# Altium schematic sheet Stepper_Driver.SchDoc
size 431 x 279 mm; SheetNumber: 3; SheetTotal: 6
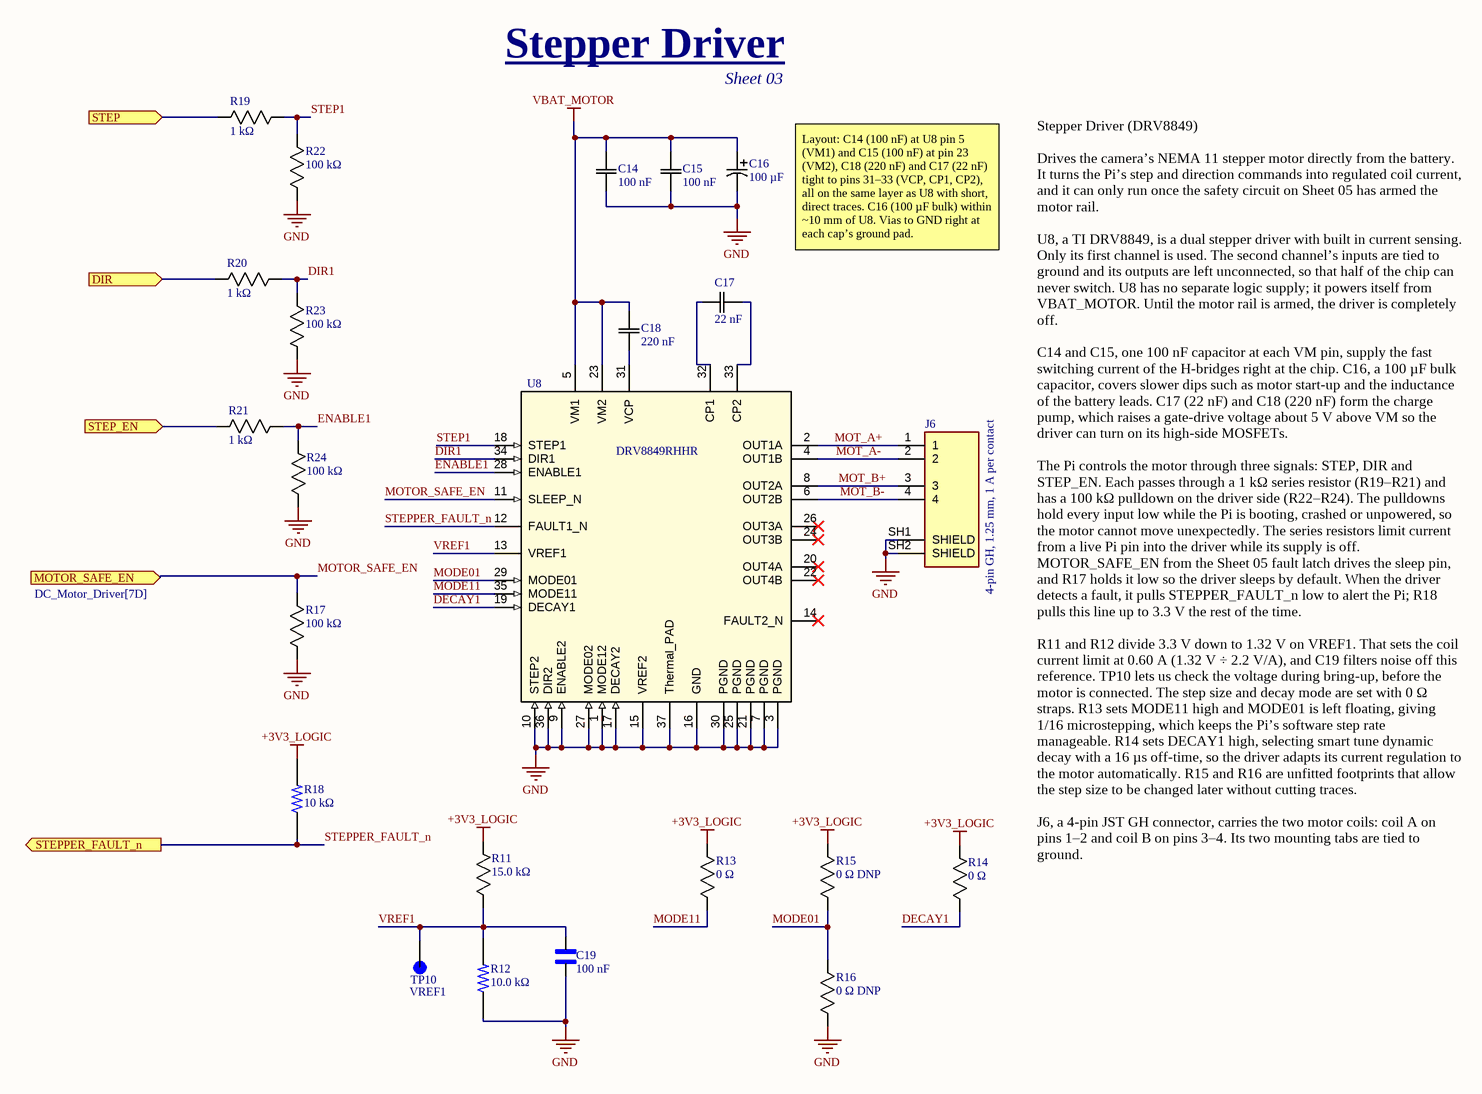
[diagram p0: Stepper_Driver.SchDoc]

## Parts
C14  100 nF  [G-155_MUR]
C15  100 nF  [G-155_MUR]
C16  100 µF  [CAP_8 X 6.2_PAN]
C17  22 nF  [G-188_MUR]
C18  220 nF  [G-188_MUR]
C19  100 nF  [CAPC1608X90N]
J6  4-pin GH, 1.25 mm, 1 A per contact  [JST_SM04B-GHS-TB(LF)(SN)-]
R11  15.0 kΩ  [RC0603N_YAG]
R12  10.0 kΩ  [RESC1607X60N]
R13  0 Ω  [RC0603N_YAG]
R14  0 Ω  [RC0603N_YAG]
R15  0 Ω DNP  [RC0603N_YAG]
R16  0 Ω DNP  [RC0603N_YAG]
R17  100 kΩ  [RC0603N_YAG]
R18  10 kΩ  [RESC1607X60N]
R19  1 kΩ  [RC0603N_YAG]
R20  1 kΩ  [RC0603N_YAG]
R21  1 kΩ  [RC0603N_YAG]
R22  100 kΩ  [RC0603N_YAG]
R23  100 kΩ  [RC0603N_YAG]
R24  100 kΩ  [RC0603N_YAG]
TP10  VREF1  [KEYSTONE_5015]
U8  DRV8849RHHR  [RHH0036H-IPC_A]

## Ports
DIR (in), MOTOR_SAFE_EN (in, see DC_Motor_Driver[7D]), STEP (in), STEP_EN (in), STEPPER_FAULT_n (out)

## Nets
+3V3_LOGIC: R11.1 R13.2 R14.2 R15.1 R18.2
GND: C14.2 C15.2 C16.2 C19.1 J6.SH1(SHIELD) J6.SH2(SHIELD) R12.1 R16.2 R17.1 R22.1 R23.1 R24.1 U8.1(MODE12) U8.3(PGND) U8.7(PGND) U8.9(ENABLE2) U8.10(STEP2) U8.15(VREF2) U8.16(GND) U8.17(DECAY2) U8.21(PGND) U8.25(PGND) U8.27(MODE02) U8.30(PGND) U8.36(DIR2) U8.37(Thermal_PAD)
VBAT_MOTOR: C14.1 C15.1 C16.1 C18.2 U8.5(VM1) U8.23(VM2)
DECAY1: R14.1 U8.19(DECAY1)
DIR: R20.1 ; port DIR
DIR1: R20.2 R23.2 U8.34(DIR1)
ENABLE1: R21.2 R24.2 U8.28(ENABLE1)
MODE01: R15.2 R16.1 U8.29(MODE01)
MODE11: R13.1 U8.35(MODE11)
MOT_A+: J6.1 U8.2(OUT1A)
MOT_A-: J6.2 U8.4(OUT1B)
MOT_B+: J6.3 U8.8(OUT2A)
MOT_B-: J6.4 U8.6(OUT2B)
MOTOR_SAFE_EN: R17.2 U8.11(SLEEP_N) ; port MOTOR_SAFE_EN
STEP: R19.1 ; port STEP
STEP1: R19.2 R22.2 U8.18(STEP1)
STEP_EN: R21.1 ; port STEP_EN
STEPPER_FAULT_n: R18.1 U8.12(FAULT1_N) ; port STEPPER_FAULT_n
VREF1: C19.2 R11.2 R12.2 TP10.TP U8.13(VREF1)
NetC17_1: C17.1 U8.32(CP1)
NetC17_2: C17.2 U8.33(CP2)
NetC18_1: C18.1 U8.31(VCP)

Not connected (* = marked no-connect by the designer): U8 14(FAULT2_N)* 20(OUT4A)* 22(OUT4B)* 24(OUT3B)* 26(OUT3A)*

## Notes on the sheet
- Stepper Driver
- Sheet 03
- Layout: C14 (100 nF) at U8 pin 5 (VM1) and C15 (100 nF) at pin 23 (VM2), C18 (220 nF) and C17 (22 nF) tight to pins 31–33 (VCP, CP1, CP2), all on the same layer as U8 with short, direct traces. C16 (100 µF bulk) within ~10 mm of U8. Vias to GND right at each cap’s ground pad.
- Stepper Driver (DRV8849)
  Drives the camera’s NEMA 11 stepper motor directly from the battery. It turns the Pi’s step and direction commands into regulated coil current, and it can only run once the safety circuit on Sheet 05 has armed the motor rail.
  U8, a TI DRV8849, is a dual stepper driver with built in current sensing. Only its first channel is used. The second channel’s inputs are tied to ground and its outputs are left unconnected, so that half of the chip can never switch. U8 has no separate logic supply; it powers itself from VBAT_MOTOR. Until the motor rail is armed, the driver is completely off.
  C14 and C15, one 100 nF capacitor at each VM pin, supply the fast switching current of the H-bridges right at the chip. C16, a 100 µF bulk capacitor, covers slower dips such as motor start-up and the inductance of the battery leads. C17 (22 nF) and C18 (220 nF) form the charge pump, which raises a gate-drive voltage about 5 V above VM so the driver can turn on its high-side MOSFETs.
  The Pi controls the motor through three signals: STEP, DIR and STEP_EN. Each passes through a 1 kΩ series resistor (R19–R21) and has a 100 kΩ pulldown on the driver side (R22–R24). The pulldowns hold every input low while the Pi is booting, crashed or unpowered, so the motor cannot move unexpectedly. The series resistors limit current from a live Pi pin into the driver while its supply is off. MOTOR_SAFE_EN from the Sheet 05 fault latch drives the sleep pin, and R17 holds it low so the driver sleeps by default. When the driver detects a fault, it pulls STEPPER_FAULT_n low to alert the Pi; R18 pulls this line up to 3.3 V the rest of the time.
  R11 and R12 divide 3.3 V down to 1.32 V on VREF1. That sets the coil current limit at 0.60 A (1.32 V ÷ 2.2 V/A), and C19 filters noise off this reference. TP10 lets us check the voltage during bring-up, before the motor is connected. The step size and decay mode are set with 0 Ω straps. R13 sets MODE11 high and MODE01 is left floating, giving 1/16 microstepping, which keeps the Pi’s software step rate manageable. R14 sets DECAY1 high, selecting smart tune dynamic decay with a 16 µs off-time, so the driver adapts its current regulation to the motor automatically. R15 and R16 are unfitted footprints that allow the step size to be changed later without cutting traces.
  J6, a 4-pin JST GH connector, carries the two motor coils: coil A on pins 1–2 and coil B on pins 3–4. Its two mounting tabs are tied to ground.
- DWG. NO.
- REV.
- SHT.
- THIS DOCUMENT AND THE DATA DISCLOSED HEREIN OR HEREWITH IS THE PROPERTY OF ALTIUM LIMITED AND MAY BE FREELY DISTRIBUTED IN WHOLE. NO RIGHTS ARE RESERVED OR EXPRESS OR IMPLIED WARANTEE GIVEN.
- REVISION
- DESCRIPTION
- DATE
- APPROVED
- ENG:
- APPROVALS
- PROJECT
- DSN:
- CHK:
- REFERENCE DOCUMENTS
- PROJECT REVISION:
- TITLE
- DOCUMENT REVISION:
- DESIGN ITEM:
- BOM:
- FAB DWG:
- PCB DWG:
- ASSY DWG:
- SCALE:
- SIZE
- B
- CAGE CODE
- FILE NAME
- DWG NO.
- SHEET
- OF
- REV

## Library data of the parts
C14 C15 = GRM1555C1H102JA01J: Murata GRM188R71H104KA93D / GRM1555C1H102JA01J / https://www.digikey.com/en/products/detail/murata-electronics/GRM1555C1H102JA01J/2543864?gclsrc=aw.ds&gad_source=1&gad_campaignid=120565755&gbraid=0AAAAADrbLlhBK6RSg5Z4LknwR3Ym5VOXW&gclid=CjwKCAjwxpvXBhASEiwAue4B4XeGUFuPXtPsfbeMkMZ75lyWP21xskG24YTykYGaX4kwoUWy9fCN8hoClL4QAvD_BwE; Copyright: Copyright (C) 2025 Ultra Librarian. All rights reserved.; Manufacturer_Name: Murata; Manufacturer_Part_Number: GRM1555C1H102JA01J
C16 = EEE-FK1E101P: EEE-FK1E101P / Panasonic EEE-FK1E101P / 100 µF 25 V aluminum / https://www.digikey.com/en/products/detail/panasonic-industry/EEE-FK1E101P/765965; Copyright: Copyright (C) 2025 Ultra Librarian. All rights reserved.; Manufacturer_Name: Panasonic; Manufacturer_Part_Number: EEE-FK1E101P
C17 = GRM188R71H223KA01D: GRM188R71H223KA01D / Murata GRM188R71H223KA01D / 22 nF 50 V X7R / https://www.digikey.com/en/products/detail/murata-electronics/GRM188R71H223KA01D/587147?s=N4IgTCBcDaIOICUCyBGAHGhB2FAJMYAzANICCADCgCIgC6AvkA; Copyright: Copyright (C) 2026 Ultra Librarian. All rights reserved.; Manufacturer_Name: Murata; Manufacturer_Part_Number: GRM188R71H223KA01D
C18 = GRM188R71C224KA01D: GRM188R71C224KA01D / 220 nF / Murata GRM188R71C224KA01D 0603 / https://www.digikey.com/en/products/detail/murata-electronics/GRM188R71C224KA01D/702557?s=N4IgTCBcDaIOICUCyBGAHGhB2FBhMYALANICCADCgCIgC6AvkA; Copyright: Copyright (C) 2026 Ultra Librarian. All rights reserved.; Manufacturer_Name: Murata; Manufacturer_Part_Number: GRM188R71C224KA01D
C19 = GRM188R71H104KA93D: SMD Capacitor X7R(EIA) with Capacitance: 0.10uF Tol. 10%. Rated Voltage: 50Vdc / GRM188R71H104KA93D / https://www.digikey.com/en/products/result?keywords=GRM188R71H104KA93D; MF: Murata; SnapEDA_Link: https://www.snapeda.com/parts/GRM188R71H104KA93D/Murata/view-part/?ref=snap; Package: 1608 Murata; Value: *; MP: GRM188R71H104KA93D; Check_prices: https://www.snapeda.com/parts/GRM188R71H104KA93D/Murata/view-part/?ref=eda
J6 = SM04B-GHS-TB(LF)(SN)-: Connector Header Surface Mount, Right Angle 4 position 0.049 (1.25mm); MF: JST Sales America Inc.; SnapEDA_Link: https://www.snapeda.com/parts/SM04B-GHS-TB(LF)(SN)/JST/view-part/?ref=snap; Package: None; Value: *; MP: SM04B-GHS-TB(LF)(SN); Check_prices: https://www.snapeda.com/parts/SM04B-GHS-TB(LF)(SN)/JST/view-part/?ref=eda
R11 = RC0603FR-0715KL: RES SMD 15K OHM 1% 1/10W 0603 / Yageo RC0603FR-0715KL / RC0603FR-0715KL / http://digikey.com/en/products/detail/yageo/RC0603FR-0715KL/726953?s=N4IgTCBcDaIEoGEAMA2JBmAYnAtEg7AIwCsA0gDIgC6AvkA; Copyright: Copyright (C) 2026 Ultra Librarian. All rights reserved.; Manufacturer_Name: Yageo; Manufacturer_Part_Number: RC0603FR-0715KL
R12 = RC0603FR-0710KL: 10 kOhms Â±1% 0.1W, 1/10W Chip Resistor 0603 (1608 Metric) Moisture Resistant Thick Film / RC0603FR-0710KL / https://www.digikey.com/en/products/result?keywords=RC0603FR-0710KL; MF: Yageo; SnapEDA_Link: https://www.snapeda.com/parts/RC0603FR-0710KL/Yageo/view-part/?ref=snap; Package: 0603 Yageo; Value: *; MP: RC0603FR-0710KL; Check_prices: https://www.snapeda.com/parts/RC0603FR-0710KL/Yageo/view-part/?ref=eda
R13-R16 = RC0603JR-070RL: RES SMD 0 OHM 1% JUMPER 1/10W 0603 / RC0603JR-070RL / https://www.digikey.com/en/products/detail/yageo/RC0603JR-070RL/726675; Manufacturer_Name: Yageo; Copyright: Copyright (C) 2025 Ultra Librarian. All rights reserved.; Manufacturer_Part_Number: RC0603JR-070RL
R17 = RC0603FR-07100KL: RES, 100 k, 1%, 0.1 W, 0603 / Yageo RC0603FR-07100KL / https://www.digikey.com/en/products/detail/yageo/RC0603FR-07100KL/726889?s=N4IgTCBcDaIEoGEAMA2JBmAYnAtEg7AIxJIDSAMiALoC%2BQA /; Copyright: Copyright (C) 2025 Ultra Librarian. All rights reserved.; Manufacturer_Name: Yageo; Manufacturer_Part_Number: RC0603FR-07100KL
R18 = RC0603FR-0710KL: 10 kOhms Â±1% 0.1W, 1/10W Chip Resistor 0603 (1608 Metric) Moisture Resistant Thick Film / Yageo RC0603FR-0710KL / https://www.digikey.com/en/products/result?keywords=RC0603FR-0710KL; SnapEDA_Link: https://www.snapeda.com/parts/RC0603FR-0710KL/Yageo/view-part/?ref=snap; Package: 0603 Yageo; Value: *; MF: Yageo; MP: RC0603FR-0710KL; Check_prices: https://www.snapeda.com/parts/RC0603FR-0710KL/Yageo/view-part/?ref=eda
R19-R21 = RC0603FR-071KL: RES SMD 1K OHM 1% 1/10W 0603 / RC0603FR-071KL / https://www.digikey.com/en/products/result?keywords=RC0603FR-071KL; Manufacturer_Name: Yageo; Copyright: Copyright (C) 2025 Ultra Librarian. All rights reserved.; Manufacturer_Part_Number: RC0603FR-071KL
R22-R24 = RC0603FR-07100KL: RES, 100 k, 1%, 0.1 W, 0603 / RC0603FR-07100KL / https://www.digikey.com/en/products/result?keywords=RC0603FR-07100KL /; Manufacturer_Name: Yageo; Copyright: Copyright (C) 2025 Ultra Librarian. All rights reserved.; Manufacturer_Part_Number: RC0603FR-07100KL
TP10 = 5015: Test Point Micro Mini SMT Phos Bronze/Silver 1000pc Tape & Reel | Keystone Electronics 5015; SnapEDA_Link: https://www.snapeda.com/parts/5015/Keystone/view-part/?ref=snap; Package: None; Value: *; MF: Keystone Electronics; MP: 5015; Check_prices: https://www.snapeda.com/parts/5015/Keystone/view-part/?ref=eda
U8 = DRV8849RHHR: 38-V 1.5-A dual stepper motor driver with smart tune and integrated current sensing 36-VQFN -40 to 125 / https://www.digikey.com/en/products/detail/texas-instruments/DRV8849RHHR/19236315; Manufacturer_Name: Texas Instruments; TYPE: TYPE; RefDes: RefDes; Copyright: Copyright (C) 2025 Ultra Librarian. All rights reserved.; Manufacturer_Part_Number: DRV8849RHHR